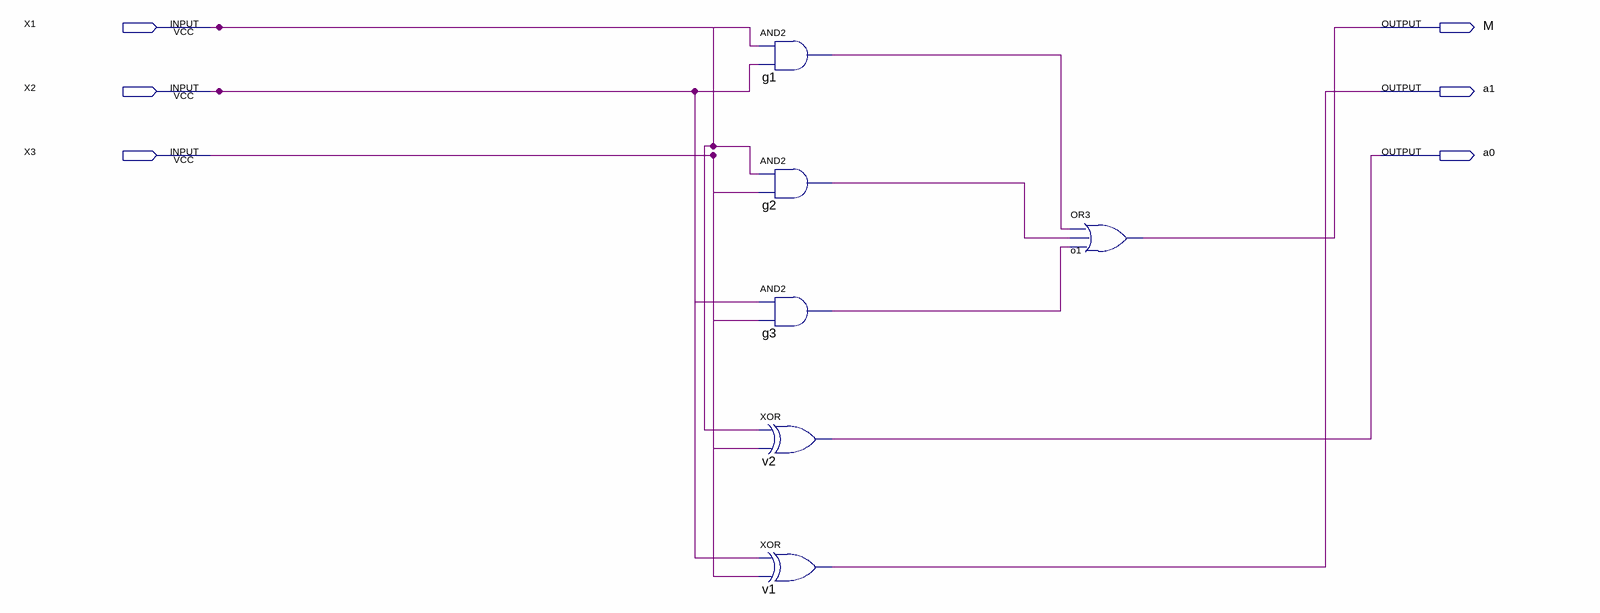
[diagram p0: schematic sheet]
// Quartus schematic majority.bdf as structural Verilog: 6 symbols, 6 pins
module majority (
  input  X1,
  input  X2,
  input  X3,
  output M,
  output a1,
  output a0
);

  wire g1_out, g2_out, g3_out;

  and g1 (g1_out, X1, X2);
  and g2 (g2_out, X1, X3);
  and g3 (g3_out, X2, X3);
  xor v2 (a0, X1, X3);
  xor v1 (a1, X2, X3);
  or o1 (M, g1_out, g2_out, g3_out);
endmodule
